# Altium schematic sheet ESP32-Custom_Module.SchDoc
size 254 x 203 mm; SheetNumber: 1; SheetTotal: 1
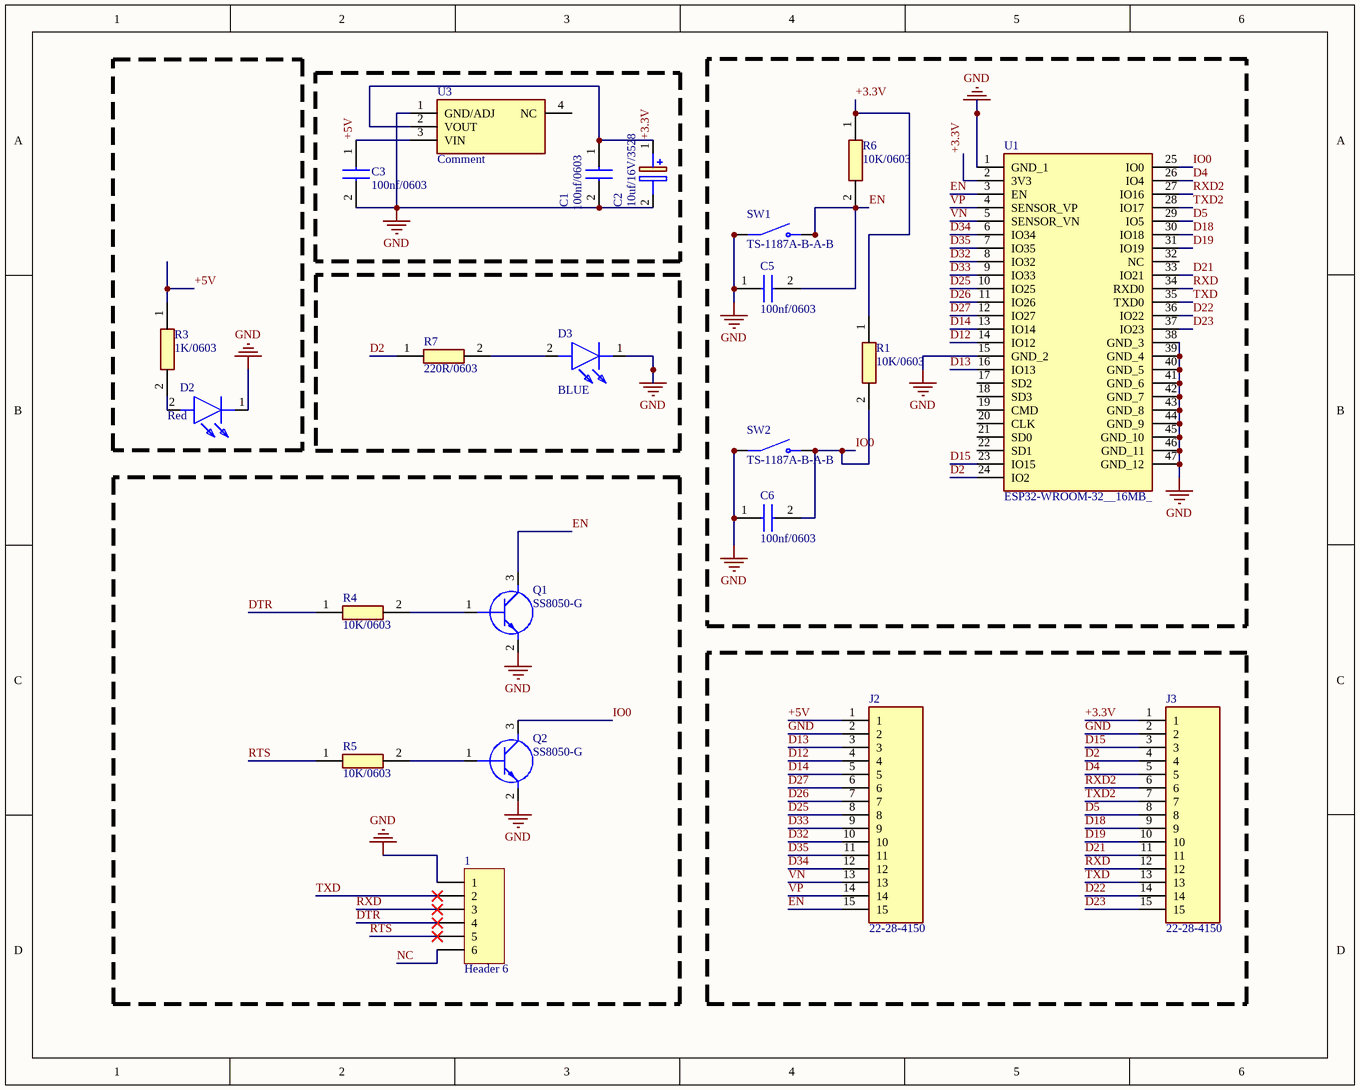
[diagram p0: ESP32-Custom_Module.SchDoc]

## Parts
1  Header 6  [HDR1X6]
C1  100nf/0603  [CAPC1608X90N]
C2  10uf/16V/3528  [CAPPM3528X210N]
C3  100nf/0603  [CAPC1608X90N]
C5  100nf/0603  [CAPC1608X90N]
C6  100nf/0603  [CAPC1608X90N]
D2  Red  [LEDC2012X70N - duplicate]
D3  BLUE  [LEDC2012X70N]
J2  22-28-4150  [HDRV15W66P0X254_1X15_3810X249X838P]
J3  22-28-4150  [HDRV15W66P0X254_1X15_3810X249X838P]
Q1  SS8050-G  [SOT95P240X115-3N]
Q2  SS8050-G  [SOT95P240X115-3N]
R1  10K/0603  [RESC1608X55N]
R3  1K/0603  [RESC1608X55N]
R4  10K/0603  [RESC1608X55N]
R5  10K/0603  [RESC1608X55N]
R6  10K/0603  [RESC1608X55N]
R7  220R/0603  [RESC1608X55N]
SW1  TS-1187A-B-A-B  [SW_TS-1187A-B-A-B]
SW2  TS-1187A-B-A-B  [SW_TS-1187A-B-A-B]
U1  ESP32-WROOM-32__16MB_  [ESP32WROOM3216MB]
U3  Comment  [SOT229P700X180-4N]

## Nets
GND: 1.1 C1.2 C2.2(-) C3.2 C5.1 C6.1 D2.1(K) D3.1(K) J2.2 J3.2 Q1.2(E) Q2.2(E) SW1.A(COM) SW1.B(COM) SW2.A(COM) SW2.B(COM) U1.1(GND_1) U1.15(GND_2) U1.38(GND_3) U1.39(GND_4) U1.40(GND_5) U1.41(GND_6) U1.42(GND_7) U1.43(GND_8) U1.44(GND_9) U1.45(GND_10) U1.46(GND_11) U1.47(GND_12) U3.1(GND/ADJ)
+3.3V: C1.1 C2.1(+) J3.1 R1.1 R6.1 U1.2(3V3) U3.2(VOUT)
+5V: C3.1 J2.1 R3.1 U3.3(VIN)
D2: J3.4 R7.1 U1.24(IO2)
D4: J3.5 U1.26(IO4)
D5: J3.8 U1.29(IO5)
D12: J2.4 U1.14(IO12)
D13: J2.3 U1.16(IO13)
D14: J2.5 U1.13(IO14)
D15: J3.3 U1.23(IO15)
D18: J3.9 U1.30(IO18)
D19: J3.10 U1.31(IO19)
D21: J3.11 U1.33(IO21)
D22: J3.14 U1.36(IO22)
D23: J3.15 U1.37(IO23)
D25: J2.8 U1.10(IO25)
D26: J2.7 U1.11(IO26)
D27: J2.6 U1.12(IO27)
D32: J2.10 U1.8(IO32)
D33: J2.9 U1.9(IO33)
D34: J2.12 U1.6(IO34)
D35: J2.11 U1.7(IO35)
DTR: 1.4 R4.1
EN: C5.2 J2.15 Q1.3(C) R6.2 SW1.C(NO) SW1.D(NO) U1.3(EN)
IO0: C6.2 Q2.3(C) R1.2 SW2.C(NO) SW2.D(NO) U1.25(IO0)
NC: 1.6
RTS: 1.5 R5.1
RXD: 1.3 J3.12 U1.34(RXD0)
RXD2: J3.6 U1.27(IO16)
TXD: 1.2 J3.13 U1.35(TXD0)
TXD2: J3.7 U1.28(IO17)
VN: J2.13 U1.5(SENSOR_VN)
VP: J2.14 U1.4(SENSOR_VP)
NetD2_2: D2.2(A) R3.2
NetD3_2: D3.2(A) R7.2
NetQ1_1: Q1.1(B) R4.2
NetQ2_1: Q2.1(B) R5.2

Not connected (* = marked no-connect by the designer): U1 17(SD2) 18(SD3) 19(CMD) 20(CLK) 21(SD0) 22(SD1) 32(NC); U3 4(NC)

## Library data of the parts
1 = Header 6: Header, 6-Pin; LatestRevisionDate: 17-Jul-2002; LatestRevisionNote: Re-released for DXP Platform.; Publisher: Altium Limited
C1 C3 C5 C6 = C0603C105K4RACTU7042: Capacitor; Manufacturer_Name: Yageo Group; Datasheet Link: https://www.arrow.com/en/products/c0603c105k4ractu7042/kemet-corporation; Height: 0.9mm; Manufacturer_Part_Number: C0603C105K4RACTU7042; Arrow Part Number: C0603C105K4RACTU7042; Arrow Price/Stock: https://www.arrow.com/en/products/c0603c105k4ractu7042/kemet-corporation
C2 = TAJB475K025RNJ: Capacitor Polarised; Manufacturer_Name: Kyocera AVX; Datasheet Link: http://datasheets.avx.com/TAJ.pdf; Height: 2.1mm; Manufacturer_Part_Number: TAJB475K025RNJ; Mouser Part Number: 581-TAJB475K025R; Mouser Price/Stock: https://www.mouser.co.uk/ProductDetail/AVX/TAJB475K025RNJ?qs=mgX5NEyWO4Sl7CIvkz4Jiw%3D%3D; Arrow Part Number: TAJB475K025RNJ; Arrow Price/Stock: https://www.arrow.com/en/products/tajb475k025rnj/avx
D2 = 597-3305-607F: LED; Manufacturer_Name: Dialight; Datasheet Link: https://s3-us-west-2.amazonaws.com/catsy.557/C18794.pdf; Height: 0.7mm; Manufacturer_Part_Number: 597-3305-607F; Mouser Part Number: 645-597-3305-607F; Mouser Price/Stock: https://www.mouser.co.uk/ProductDetail/Dialight/597-3305-607F?qs=BcvNGmdp0KXCFSNjF8jswA%3D%3D; Arrow Part Number: 597-3305-607F; Arrow Price/Stock: https://www.arrow.com/en/products/597-3305-607f/dialight?region=nac
D3 = 597-3305-607F_1: LED; Manufacturer_Name: Dialight; Datasheet Link: https://s3-us-west-2.amazonaws.com/catsy.557/C18794.pdf; Height: 0.7mm; Manufacturer_Part_Number: 597-3305-607F; Mouser Part Number: 645-597-3305-607F; Mouser Price/Stock: https://www.mouser.co.uk/ProductDetail/Dialight/597-3305-607F?qs=BcvNGmdp0KXCFSNjF8jswA%3D%3D; Arrow Part Number: 597-3305-607F; Arrow Price/Stock: https://www.arrow.com/en/products/597-3305-607f/dialight?region=nac
J2 J3 = 22-28-4150: Connector; Manufacturer_Name: Molex; Datasheet Link: https://componentsearchengine.com/Datasheets/1/22-28-4150.pdf; Height: 8.38mm; Manufacturer_Part_Number: 22-28-4150; Mouser Part Number: 538-22-28-4150; Mouser Price/Stock: https://www.mouser.co.uk/ProductDetail/Molex/22-28-4150?qs=M5Ic86%252BuP8aClMFgmZrq7g%3D%3D
Q1 Q2 = SS8050-G: Transistor BJT NPN; Manufacturer_Name: Comchip Technology; Datasheet Link: https://datasheet.datasheetarchive.com/originals/distributors/DKDS-12/229454.pdf; Height: 1.15mm; Manufacturer_Part_Number: SS8050-G; Mouser Part Number: 750-SS8050-G; Mouser Price/Stock: https://www.mouser.co.uk/ProductDetail/Comchip-Technology/SS8050-G?qs=LLUE9lz1YbcHg%252BWLMAtcrQ%3D%3D; Arrow Part Number: SS8050-G; Arrow Price/Stock: https://www.arrow.com/en/products/ss8050-g/comchip-technology?region=nac
R1 R3-R7 = CRGCQ0603J10K: Resistor; Manufacturer_Name: TE Connectivity; Datasheet Link: https://4donline.ihs.com/images/VipMasterIC/IC/TYEL/TYEL-S-A0004929575/TYEL-S-A0004929575-1.pdf?hkey=52A5661711E402568146F3353EA87419; Height: 0.55mm; Manufacturer_Part_Number: CRGCQ0603J10K; Mouser Part Number: 279-CRGCQ0603J10K; Mouser Price/Stock: https://www.mouser.co.uk/ProductDetail/TE-Connectivity-Holsworthy/CRGCQ0603J10K?qs=wUXugUrL1qzulhGjUR%2FJ4g%3D%3D
SW1 SW2 = TS-1187A-B-A-B: SPST 50mA @ 12VDC Top Actuated Round Button 160gf SMD Tactile Switches RoHS; MP: TS-1187A-B-A-B; Value: *; Price: None; Package: None; Availability: Unavailable
U1 = ESP32-WROOM-32__16MB_: Integrated Circuit; Manufacturer_Name: Espressif Systems; Manufacturer_Part_Number: ESP32-WROOM-32 (16MB); Datasheet Link: https://www.espressif.com/sites/default/files/documentation/esp32_datasheet_en.pdf; Height: 3.2mm; Mouser Part Number: 356-ESPWROOM3216MB; Mouser Price/Stock: https://www.mouser.co.uk/ProductDetail/Espressif-Systems/ESP32-WROOM-32-16MB?qs=w%2Fv1CP2dgqrcPyEPuQvO1A%3D%3D
U3 = AMS1117-3.3: Integrated Circuit; Manufacturer_Name: Advanced; Datasheet Link: https://datasheet.datasheetarchive.com/originals/distributors/Datasheets-28/DSA-550594.pdf; Height: 1.8mm; Manufacturer_Part_Number: AMS1117-3.3